# Altium project Project1.PrjPcb
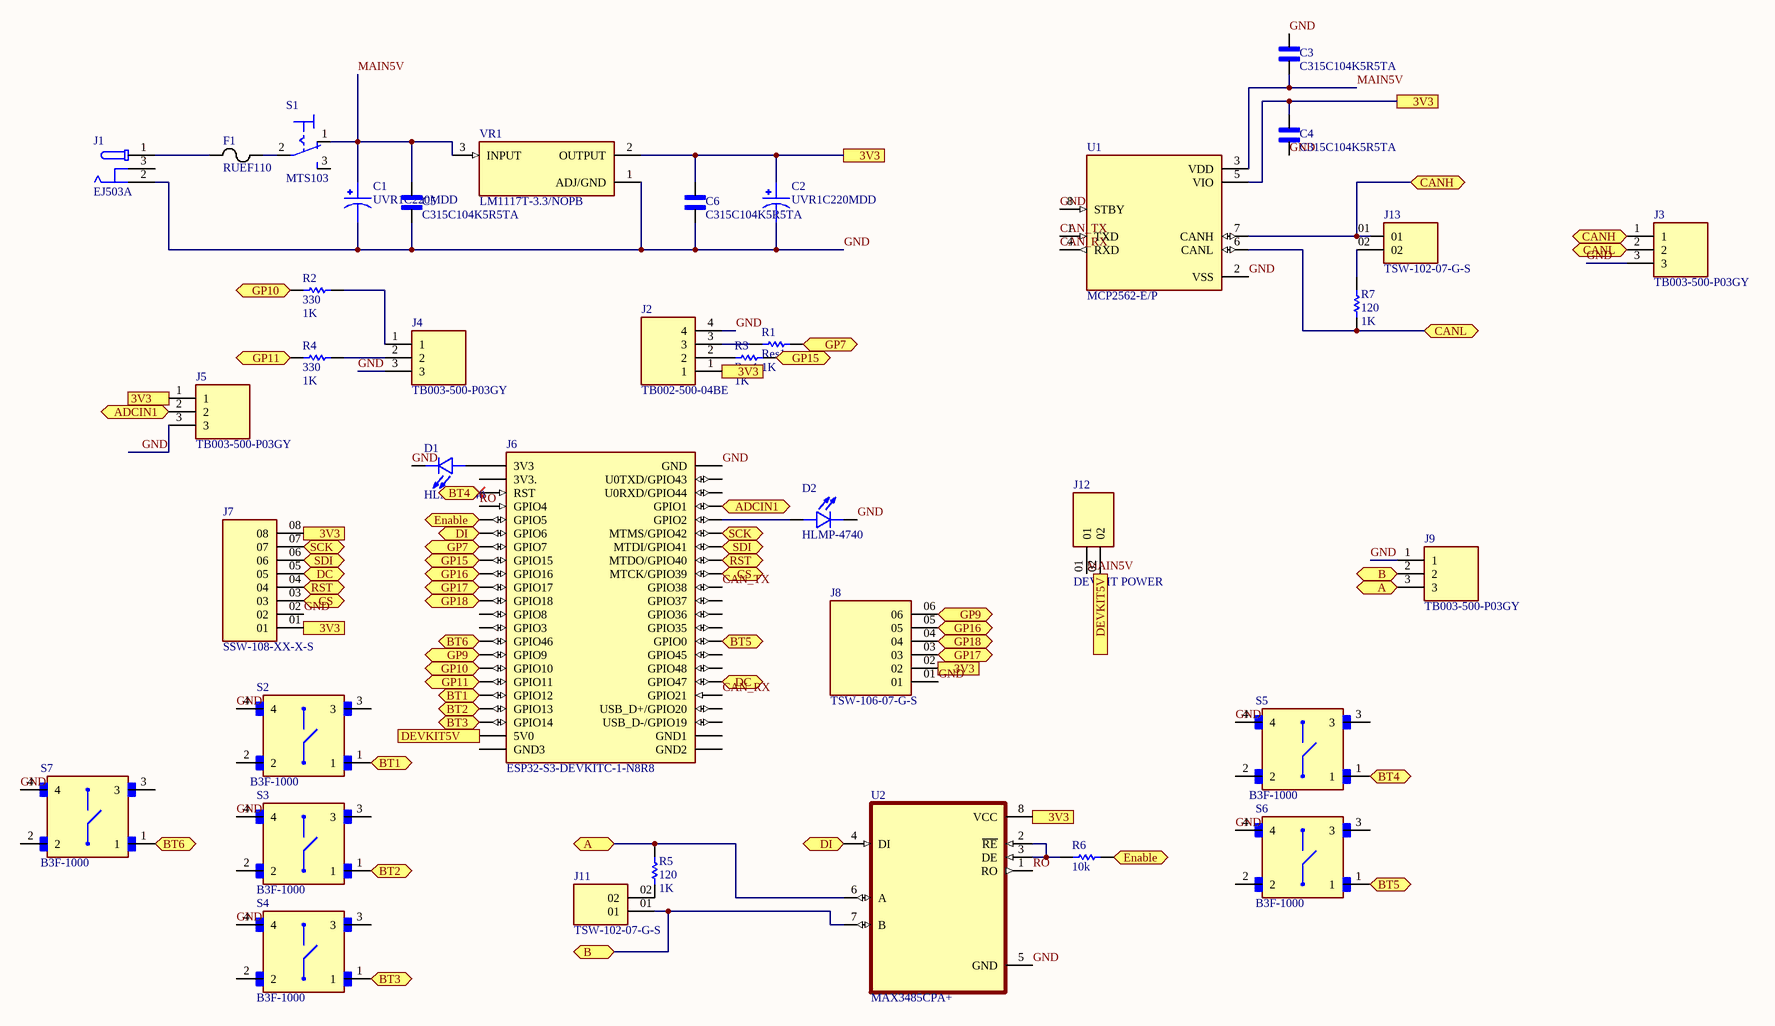
[diagram p0: Sheet1.SchDoc]
1 sheet, 38 parts. Net scope: flat (ports and power ports of the same name join across sheets).
Board file: PCB1.PcbDoc

## Sheet Sheet1.SchDoc
size A3; SheetNumber: 1; SheetTotal: 1

### Parts
C1  UVR1C220MDD  [CAPPRD200W50D550H1250]
C2  UVR1C220MDD  [CAPPRD200W50D550H1250]
C3  C315C104K5R5TA  [CAPRR254W54L381T254H466B]
C4  C315C104K5R5TA  [CAPRR254W54L381T254H466B]
C5  C315C104K5R5TA  [CAPRR254W54L381T254H466B]
C6  C315C104K5R5TA  [CAPRR254W54L381T254H466B]
D1  HLMP-4740  [LEDRD254W47D584H1078]
D2  HLMP-4740  [LEDRD254W47D584H1078]
F1  RUEF110  [FUSRR505W81L660T250H1360]
J1  EJ503A  [MPD_EJ503A]
J2  TB002-500-04BE  [CUI_TB002-500-04BE]
J3  TB003-500-P03GY  [CUI_TB003-500-P03GY]
J4  TB003-500-P03GY  [CUI_TB003-500-P03GY]
J5  TB003-500-P03GY  [CUI_TB003-500-P03GY]
J6  ESP32-S3-DEVKITC-1-N8R8  [ESP32-S3-DEVKITC-1-N8R8]
J7  SSW-108-XX-X-S  [SAMTEC_SSW-108-XX-X-S]
J8  TSW-106-07-G-S  [SAMTEC_TSW-106-07-G-S]
J9  TB003-500-P03GY  [CUI_TB003-500-P03GY]
J11  TSW-102-07-G-S  [SAMTEC_TSW-102-07-G-S]
J12  DEVKIT POWER  [SAMTEC_TSW-102-07-G-S]
J13  TSW-102-07-G-S  [SAMTEC_TSW-102-07-G-S]
R1  Res1  value 1K  [AXIAL-0.3]
R2  330  value 1K  [AXIAL-0.3]
R3  Res1  value 1K  [AXIAL-0.3]
R4  330  value 1K  [AXIAL-0.3]
R5  120  value 1K  [AXIAL-0.3]
R6  10k  [AXIAL-0.3]
R7  120  value 1K  [AXIAL-0.3]
S1  MTS103  [MTS103]
S2  B3F-1000  [SW_B3F-1000]
S3  B3F-1000  [SW_B3F-1000]
S4  B3F-1000  [SW_B3F-1000]
S5  B3F-1000  [SW_B3F-1000]
S6  B3F-1000  [SW_B3F-1000]
S7  B3F-1000  [SW_B3F-1000]
U1  MCP2562-E/P  [DIP787W45P254L1016H533Q8]
U2  MAX3485CPA+  [DIP762W47P254L991H457Q8]
VR1  LM1117T-3.3/NOPB  [TO254P1054X470X1955-3]

### Ports
3V3, A (bidir), ADCIN1 (bidir), B (bidir), BT1 (bidir), BT2 (bidir), BT3 (bidir), BT4 (bidir), BT5 (bidir), BT6 (bidir), CANH (bidir), CANL (bidir), CS (bidir), DC (bidir), DEVKIT5V, DI (bidir), Enable (bidir), GP7 (bidir), GP9 (bidir), GP10 (bidir), GP11 (bidir), GP15 (bidir), GP16 (bidir), GP17 (bidir), GP18 (bidir), RST (bidir), SCK (bidir), SDI (bidir)

### Nets
3V3: C2.1 C4.2 C6.2 J2.1 J5.1 J7.01 J7.08 J8.02 U1.5(VIO) U2.8(VCC) VR1.2(OUTPUT) ; port 3V3
A: J9.3 R5.1 U2.6(A) ; port A
ADCIN1: J5.2 J6.J3_4(GPIO1) ; port ADCIN1
B: J9.2 J11.01 U2.7(B) ; port B
BT1: J6.J1_18(GPIO12) S2.1 ; port BT1
BT2: J6.J1_19(GPIO13) S3.1 ; port BT2
BT3: J6.J1_20(GPIO14) S4.1 ; port BT3
BT4: J6.J1_3(RST) S5.1 ; port BT4
BT5: J6.J3_14(GPIO0) S6.1 ; port BT5
BT6: J6.J1_14(GPIO46) S7.1 ; port BT6
CAN_RX: J6.J3_18(GPIO21) U1.4(RXD)
CAN_TX: J6.J3_10(GPIO38) U1.1(TXD)
CANH: J3.1 J13.01 U1.7(CANH) ; port CANH
CANL: J3.2 R7.1 U1.6(CANL) ; port CANL
CS: J6.J3_9(MTCK/GPIO39) J7.03 ; port CS
DC: J6.J3_17(GPIO47) J7.05 ; port DC
DEVKIT5V: J6.J1_21(5V0) J12.02 ; port DEVKIT5V
DI: J6.J1_6(GPIO6) U2.4(DI) ; port DI
Enable: J6.J1_5(GPIO5) R6.1 ; port Enable
GND: C1.2 C2.2 C3.2 C4.1 C5.1 C6.1 D1.1(C) D2.1(C) J1.2 J2.4 J3.3 J4.3 J5.3 J6.J3_1(GND) J7.02 J8.01 J9.1 S2.4 S3.4 S4.4 S5.4 S6.4 S7.4 U1.2(VSS) U1.8(STBY) U2.5(GND) VR1.1(ADJ/GND)
GP7: J6.J1_7(GPIO7) R1.2 ; port GP7
GP9: J6.J1_15(GPIO9) J8.06 ; port GP9
GP10: J6.J1_16(GPIO10) R2.1 ; port GP10
GP11: J6.J1_17(GPIO11) R4.1 ; port GP11
GP15: J6.J1_8(GPIO15) R3.2 ; port GP15
GP16: J6.J1_9(GPIO16) J8.05 ; port GP16
GP17: J6.J1_10(GPIO17) J8.03 ; port GP17
GP18: J6.J1_11(GPIO18) J8.04 ; port GP18
MAIN5V: C1.1 C3.1 C5.2 J12.01 S1.1(O) U1.3(VDD) VR1.3(INPUT)
RO: J6.J1_4(GPIO4) U2.1(RO)
RST: J6.J3_8(MTDO/GPIO40) J7.04 ; port RST
SCK: J6.J3_6(MTMS/GPIO42) J7.07 ; port SCK
SDI: J6.J3_7(MTDI/GPIO41) J7.06 ; port SDI
NetD1_2: D1.2(A) J6.J1_1(3V3)
NetD2_2: D2.2(A) J6.J3_5(GPIO2)
NetF1_1: F1.1 J1.1
NetF1_2: F1.2 S1.2(P)
NetJ2_2: J2.2 R3.1
NetJ2_3: J2.3 R1.1
NetJ4_1: J4.1 R2.2
NetJ4_2: J4.2 R4.2
NetJ11_02: J11.02 R5.2
NetJ13_02: J13.02 R7.2
NetR6_2: R6.2 U2.2(~{RE}) U2.3(DE)

Not connected (* = marked no-connect by the designer): J1 3; J6 J1_2(3V3.) J1_12(GPIO8) J1_13(GPIO3) J1_22(GND3) J3_2(U0TXD/GPIO43) J3_3(U0RXD/GPIO44) J3_11(GPIO37) J3_12(GPIO36) J3_13(GPIO35) J3_15(GPIO45) J3_16(GPIO48) J3_19(USB_D+/GPIO20) J3_20(USB_D-/GPIO19) J3_21(GND1) J3_22(GND2); S1 3(S); S2 2 3; S3 2 3; S4 2 3; S5 2 3; S6 2 3; S7 2 3

### Library data of the parts
C1 C2 = UVR1C220MDD: Capacitor, Aluminum Electrolytic, Cap 22uF 16V 20%, Radial 5X11 LS 5 mm | Nichicon UVR1C220MDD; SnapEDA_Link: https://www.snapeda.com/parts/UVR1C220MDD/Nichicon/view-part/?ref=snap; Package: RADIAL-2 NICHICON; Value: *; MF: Nichicon; MP: UVR1C220MDD; Check_prices: https://www.snapeda.com/parts/UVR1C220MDD/Nichicon/view-part/?ref=eda
C3-C6 = C315C104K5R5TA: Capacitor, Ceramic, 100nF, 50VDC, 10-% Tol, 10+% Tol, X7R-TC Code, -15, 15%-TC; MF: KEMET; SnapEDA_Link: https://www.snapeda.com/parts/C315C104K5R5TA/KEMET/view-part/?ref=snap; Package: RADIAL-2 KEMET; Value: *; MP: C315C104K5R5TA; Check_prices: https://www.snapeda.com/parts/C315C104K5R5TA/KEMET/view-part/?ref=eda
D1 D2 = HLMP-4740: LED Circuit Board Indicator LED Circuit Board Indicator Single Green Diffused, Tinted 1.9V 2mA - - Through Hole, Right Angle; MF: Broadcom; SnapEDA_Link: https://www.snapeda.com/parts/HLMP-4740/Broadcom/view-part/?ref=snap; Package: Radial Broadcom / Avago; Value: *; MP: HLMP-4740; Check_prices: https://www.snapeda.com/parts/HLMP-4740/Broadcom/view-part/?ref=eda
F1 = RUEF110: Description; Manufacturer_Name: Littelfuse Inc; Copyright: Copyright (C) 2026 Ultra Librarian. All rights reserved.; Manufacturer_Part_Number: RUEF110
J1 = EJ503A: Power Barrel Connector Jack 2.10mm ID (0.083), 5.50mm OD (0.217) Through Hole, Right Angle; MF: MPD; Package: None; Price: None; Check_prices: https://www.snapeda.com/parts/EJ503A/MPD+%2528Memory+Protection+Devices%2529/view-part/?ref=eda; Value: *; SnapEDA_Link: https://www.snapeda.com/parts/EJ503A/MPD+%2528Memory+Protection+Devices%2529/view-part/?ref=snap; MP: EJ503A; Availability: In Stock; Purchase-URL: https://pricing.snapeda.com/search?q=EJ503A&ref=eda
J2 = TB002-500-04BE: 2~24 Poles, Screw Type, Horizontal, 5.0 Pitch, 22~12 (AWG), Terminal Block Connector; MF: Same Sky; SnapEDA_Link: https://www.snapeda.com/parts/TB002-500-04BE/Same+Sky/view-part/?ref=snap; Package: None; Value: *; MP: TB002-500-04BE; Check_prices: https://www.snapeda.com/parts/TB002-500-04BE/Same+Sky/view-part/?ref=eda
J3-J5 J9 = TB003-500-P03GY: 2~24 Poles, Screw Type, Horizontal, 5.0 Pitch, 26~14 (AWG), Terminal Block Connector; MANUFACTURER: Same Sky; MPN: TB003-500-P03GY; DATASHEET_URL: https://s3.amazonaws.com/snapeda/datasheet/TB003-500-P03GY_Same_Sky.pdf; STANDARD: Manufacturer Recommendations; Value: *; SOURCE_URL: https://www.snapeda.com/parts/TB003-500-P03GY/Same+Sky/view-part/
J6 = ESP32-S3-DEVKITC-1-N8R8: The ESP32-S3-DEVKITC-1-N8R8 from Espressif Systems is a development board designed for RF, RFID, and wireless applications. It supports 802.11 b/g/n Wi-Fi and BluetoothÂ® 5.x (BLE) connectivity at 2.4GHz, making it ideal for IoT and wireless communication; SnapEDA_Link: https://www.snapeda.com/parts/ESP32-S3-DEVKITC-1-N8R8/Espressif+Systems/view-part/?ref=snap; Package: None; Value: *; MF: Espressif Systems; MP: ESP32-S3-DEVKITC-1-N8R8; Check_prices: https://www.snapeda.com/parts/ESP32-S3-DEVKITC-1-N8R8/Espressif+Systems/view-part/?ref=eda
J7 = SSW-108-XX-X-S: 8 Position Receptacle Connector 0.100 (2.54mm) Through Hole, Right Angle Gold; MF: Samtec; MP: SSW-108-23-G-S; SnapEDA_Link: https://www.snapeda.com/parts/SSW-108-23-G-S/Samtec/view-part/?ref=snap; Package: None; Value: *; Check_prices: https://www.snapeda.com/parts/SSW-108-23-G-S/Samtec/view-part/?ref=eda
J8 = TSW-106-07-G-S: MF: Samtec Inc.; Value: *; Availability: Unavailable; Price: None; Package: None; MP: TSW-106-07-G-S
J11-J13 = TSW-102-07-G-S: <a href="https://pricing.snapeda.com/parts/TSW-102-07-G-S/Samtec/view-part?ref=eda">Check availability</a>; MF: Samtec Inc.; Package: None; Price: None; MP: TSW-102-07-G-S; Availability: Unavailable
  J11 J13: Value: *
  J12: Value: DEVKIT POWER
R1 R3 R6 = Res1: Resistor; Published: 8-Jun-2000; LatestRevisionDate: 17-Jul-2002; LatestRevisionNote: Re-released for DXP Platform.; PackageReference: AXIAL-0.3; Publisher: Altium Limited; PackageDescription: Axial Device, Thru-Hole; 2 Leads; 0.3 in Pin Spacing
R2 R4 = Res1: Resistor; parameters: Value=330; Published: 8-Jun-2000; LatestRevisionDate: 17-Jul-2002; LatestRevisionNote: Re-released for DXP Platform.; PackageReference: AXIAL-0.3; Publisher: Altium Limited; PackageDescription: Axial Device, Thru-Hole; 2 Leads; 0.3 in Pin Spacing
R5 R7 = Res1: Resistor; parameters: Value=120; Published: 8-Jun-2000; LatestRevisionDate: 17-Jul-2002; LatestRevisionNote: Re-released for DXP Platform.; PackageReference: AXIAL-0.3; Publisher: Altium Limited; PackageDescription: Axial Device, Thru-Hole; 2 Leads; 0.3 in Pin Spacing
S1 = MTS103: SW TOG 1P2T 6A ON-OFF-ON MINI SOL THR; MF: Not Specified; MP: MTS-103; SnapEDA_Link: https://www.snapeda.com/parts/MTS-103/CIF/view-part/?ref=snap; Package: None; Value: *; Check_prices: https://www.snapeda.com/parts/MTS-103/CIF/view-part/?ref=eda
S2-S7 = B3F-1000: Tactile Switch SPST-NO Top Actuated Through Hole; MF: Omron; Price: None; Check_prices: https://www.snapeda.com/parts/B3F-1000/Omron+Electronics+Inc-EMC+Div/view-part/?ref=eda; Purchase-URL: https://pricing.snapeda.com/search/part/B3F-1000/?ref=eda; Value: *; Package: None; Availability: In Stock; MP: B3F-1000; SnapEDA_Link: https://www.snapeda.com/parts/B3F-1000/Omron+Electronics+Inc-EMC+Div/view-part/?ref=snap
U2 = MAX3485CPA+: Single Transmitter/Receiver RS-422/RS-485 8-Pin PDIP N; MF: Analog Devices; Package: PDIP-8; Price: None; Value: *; SnapEDA_Link: https://www.snapeda.com/parts/MAX3485CPA+/Analog+Devices/view-part/?ref=snap; MP: MAX3485CPA+; Availability: Unavailable; Check_prices: https://www.snapeda.com/parts/MAX3485CPA+/Analog+Devices/view-part/?ref=eda
VR1 = LM1117T-3.3/NOPB: 800-mA 15-V linear voltage regulator; MF: Texas Instruments; SnapEDA_Link: https://www.snapeda.com/parts/LM1117T-3.3/NOPB/Texas+Instruments/view-part/?ref=snap; Package: TO-220-3 Texas Instruments; Value: *; MP: LM1117T-3.3/NOPB; Check_prices: https://www.snapeda.com/parts/LM1117T-3.3/NOPB/Texas+Instruments/view-part/?ref=eda
U1 = MCP2562-E/P: Package: None; Price: None; Value: *; MP: MCP2562-E/P; Availability: Unavailable